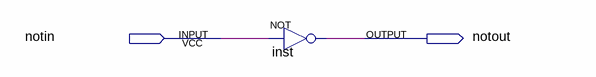
[diagram p0: schematic sheet]
// Quartus schematic Block2.bdf as structural Verilog: 1 symbols, 2 pins
module Block2 (
  input  notin,
  output notout
);

  not inst (notout, notin);
endmodule
